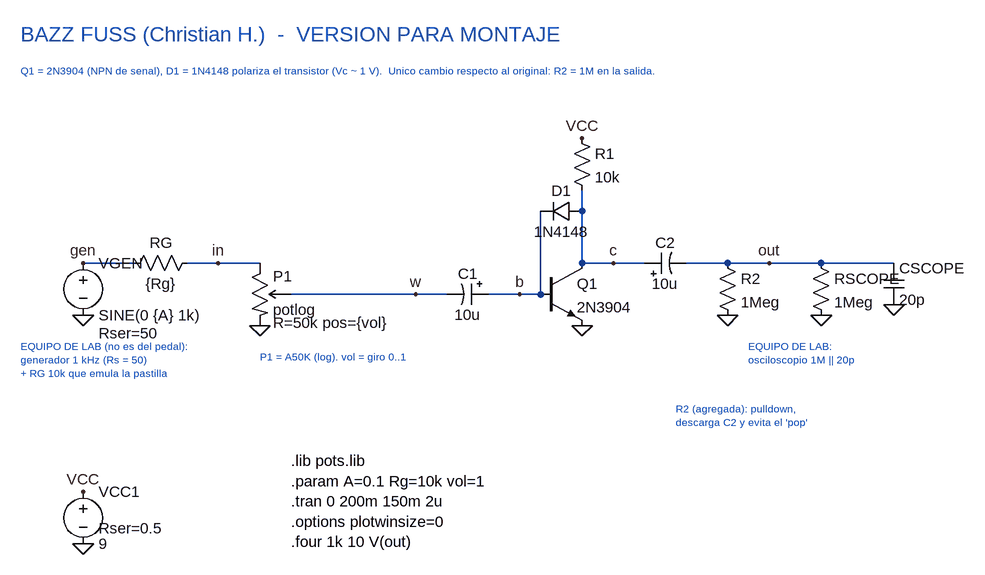
[diagram p0: schematic BazzFuss.asc]
BazzFuss.asc, the LTspice schematic file:
Version 4
SHEET 1 1800 1000
FLAG 32 256 0
FLAG 32 176 gen
WIRE 32 176 112 176
WIRE 192 176 240 176
WIRE 240 176 304 176
FLAG 240 176 in
FLAG 304 272 0
WIRE 352 224 544 224
WIRE 544 224 592 224
FLAG 544 224 w
WIRE 656 224 704 224
WIRE 704 224 736 224
FLAG 704 224 b
FLAG 800 272 0
FLAG 800 -16 VCC
WIRE 800 64 800 96
WIRE 800 96 800 176
WIRE 736 96 736 224
WIRE 800 176 848 176
WIRE 848 176 896 176
FLAG 848 176 c
WIRE 960 176 1024 176
WIRE 1024 176 1088 176
WIRE 1088 176 1168 176
FLAG 1024 256 0
TEXT 944 400 Left 1 ;R2 (agregada): pulldown,\ndescarga C2 y evita el 'pop'
FLAG 1088 176 out
WIRE 1168 176 1280 176
FLAG 1168 256 0
FLAG 1280 240 0
FLAG 32 528 VCC
FLAG 32 608 0
TEXT -64 -176 Left 3 ;BAZZ FUSS (Christian H.)  -  VERSION PARA MONTAJE
TEXT -64 -120 Left 1 ;Q1 = 2N3904 (NPN de senal), D1 = 1N4148 polariza el transistor (Vc ~ 1 V).  Unico cambio respecto al original: R2 = 1M en la salida.
TEXT -64 304 Left 1 ;EQUIPO DE LAB (no es del pedal):\ngenerador 1 kHz (Rs = 50)\n+ RG 10k que emula la pastilla
TEXT 1056 304 Left 1 ;EQUIPO DE LAB:\nosciloscopio 1M || 20p
TEXT 304 320 Left 1 ;P1 = A50K (log). vol = giro 0..1
TEXT 352 480 Left 2 !.lib pots.lib\n.param A=0.1 Rg=10k vol=1\n.tran 0 200m 150m 2u\n.options plotwinsize=0\n.four 1k 10 V(out)
SYMBOL voltage 32 160 R0
WINDOW 123 0 0 Left 0
WINDOW 39 24 124 Left 2
SYMATTR InstName VGEN
SYMATTR Value SINE(0 {A} 1k)
SYMATTR SpiceLine Rser=50
SYMBOL res 208 160 R90
WINDOW 0 0 56 VBottom 2
WINDOW 3 32 56 VTop 2
SYMATTR InstName RG
SYMATTR Value {Rg}
SYMBOL pot 304 176 R0
WINDOW 0 20 20 Left 2
WINDOW 3 20 72 Left 2
WINDOW 39 20 92 Left 2
SYMATTR InstName P1
SYMATTR Value potlog
SYMATTR SpiceLine R=50k pos={vol}
SYMBOL polcap 656 208 R90
WINDOW 0 0 32 VBottom 2
WINDOW 3 32 32 VTop 2
SYMATTR InstName C1
SYMATTR Value 10u
SYMBOL npn 736 176 R0
SYMATTR InstName Q1
SYMATTR Value 2N3904
SYMBOL res 784 -32 R0
SYMATTR InstName R1
SYMATTR Value 10k
SYMBOL diode 800 80 R90
WINDOW 0 0 32 VBottom 2
WINDOW 3 32 32 VTop 2
SYMATTR InstName D1
SYMATTR Value 1N4148
SYMBOL polcap 896 192 R270
WINDOW 0 32 32 VTop 2
WINDOW 3 0 32 VBottom 2
SYMATTR InstName C2
SYMATTR Value 10u
SYMBOL res 1008 160 R0
SYMATTR InstName R2
SYMATTR Value 1Meg
SYMBOL res 1152 160 R0
SYMATTR InstName RSCOPE
SYMATTR Value 1Meg
SYMBOL cap 1264 176 R0
SYMATTR InstName CSCOPE
SYMATTR Value 20p
SYMBOL voltage 32 512 R0
WINDOW 123 0 0 Left 0
WINDOW 39 24 72 Left 2
SYMATTR InstName VCC1
SYMATTR Value 9
SYMATTR SpiceLine Rser=0.5

The netlist it stands for:
* BazzFuss.asc
VGEN gen 0 SINE(0 {A} 1k) Rser=50
RG in gen {Rg}
XP1 in w 0 potlog R=50k pos={vol}  ; pins 1 W 3
C1 b w 10u
Q1 c b 0 0 2N3904
R1 VCC c 10k
D1 c b 1N4148
C2 c out 10u
R2 out 0 1Meg
RSCOPE out 0 1Meg
CSCOPE out 0 20p
VCC1 VCC 0 9 Rser=0.5
.model D D
.lib standard.dio
.model NPN NPN
.model PNP PNP
.lib standard.bjt
* R2 (agregada): pulldown,
* descarga C2 y evita el 'pop'
* BAZZ FUSS (Christian H.)  -  VERSION PARA MONTAJE
* Q1 = 2N3904 (NPN de senal), D1 = 1N4148 polariza el transistor (Vc ~ 1 V).  Unico cambio respecto al original: R2 = 1M en la salida.
* EQUIPO DE LAB (no es del pedal):
* generador 1 kHz (Rs = 50)
* + RG 10k que emula la pastilla
* EQUIPO DE LAB:
* osciloscopio 1M || 20p
* P1 = A50K (log). vol = giro 0..1
.lib pots.lib
.param A=0.1 Rg=10k vol=1
.tran 0 200m 150m 2u
.options plotwinsize=0
.four 1k 10 V(out)
.backanno
.end